# EasyEDA Pro project jackt-tong-yong-xiao-che-kong-zhi-qi-zhuan-li-948f377a.epro, board PCB8_1
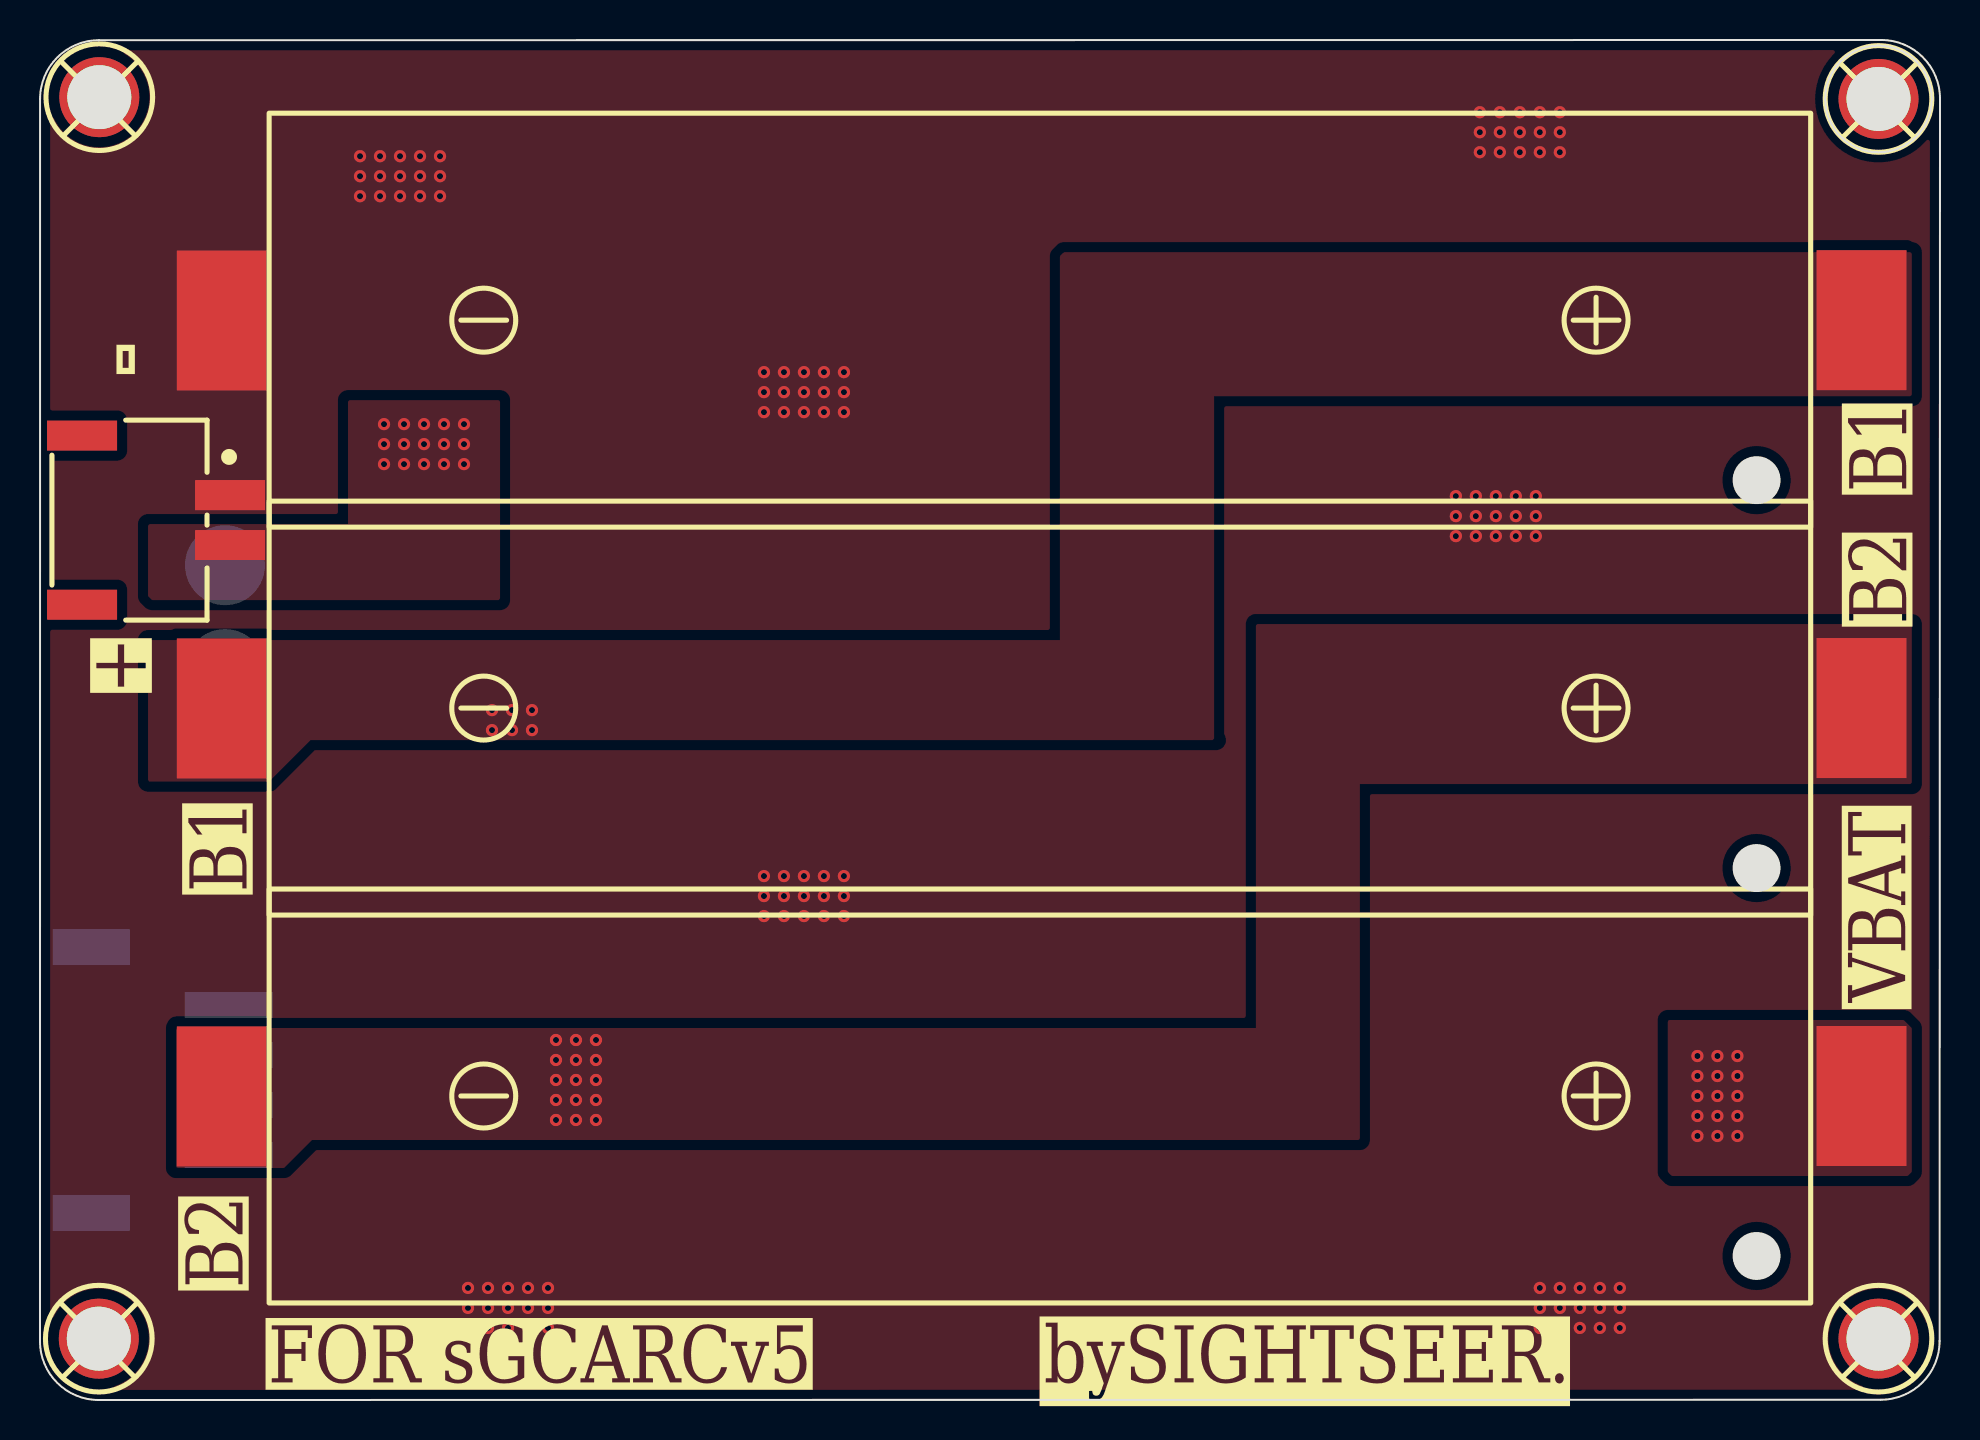
[diagram p12: board, top side]
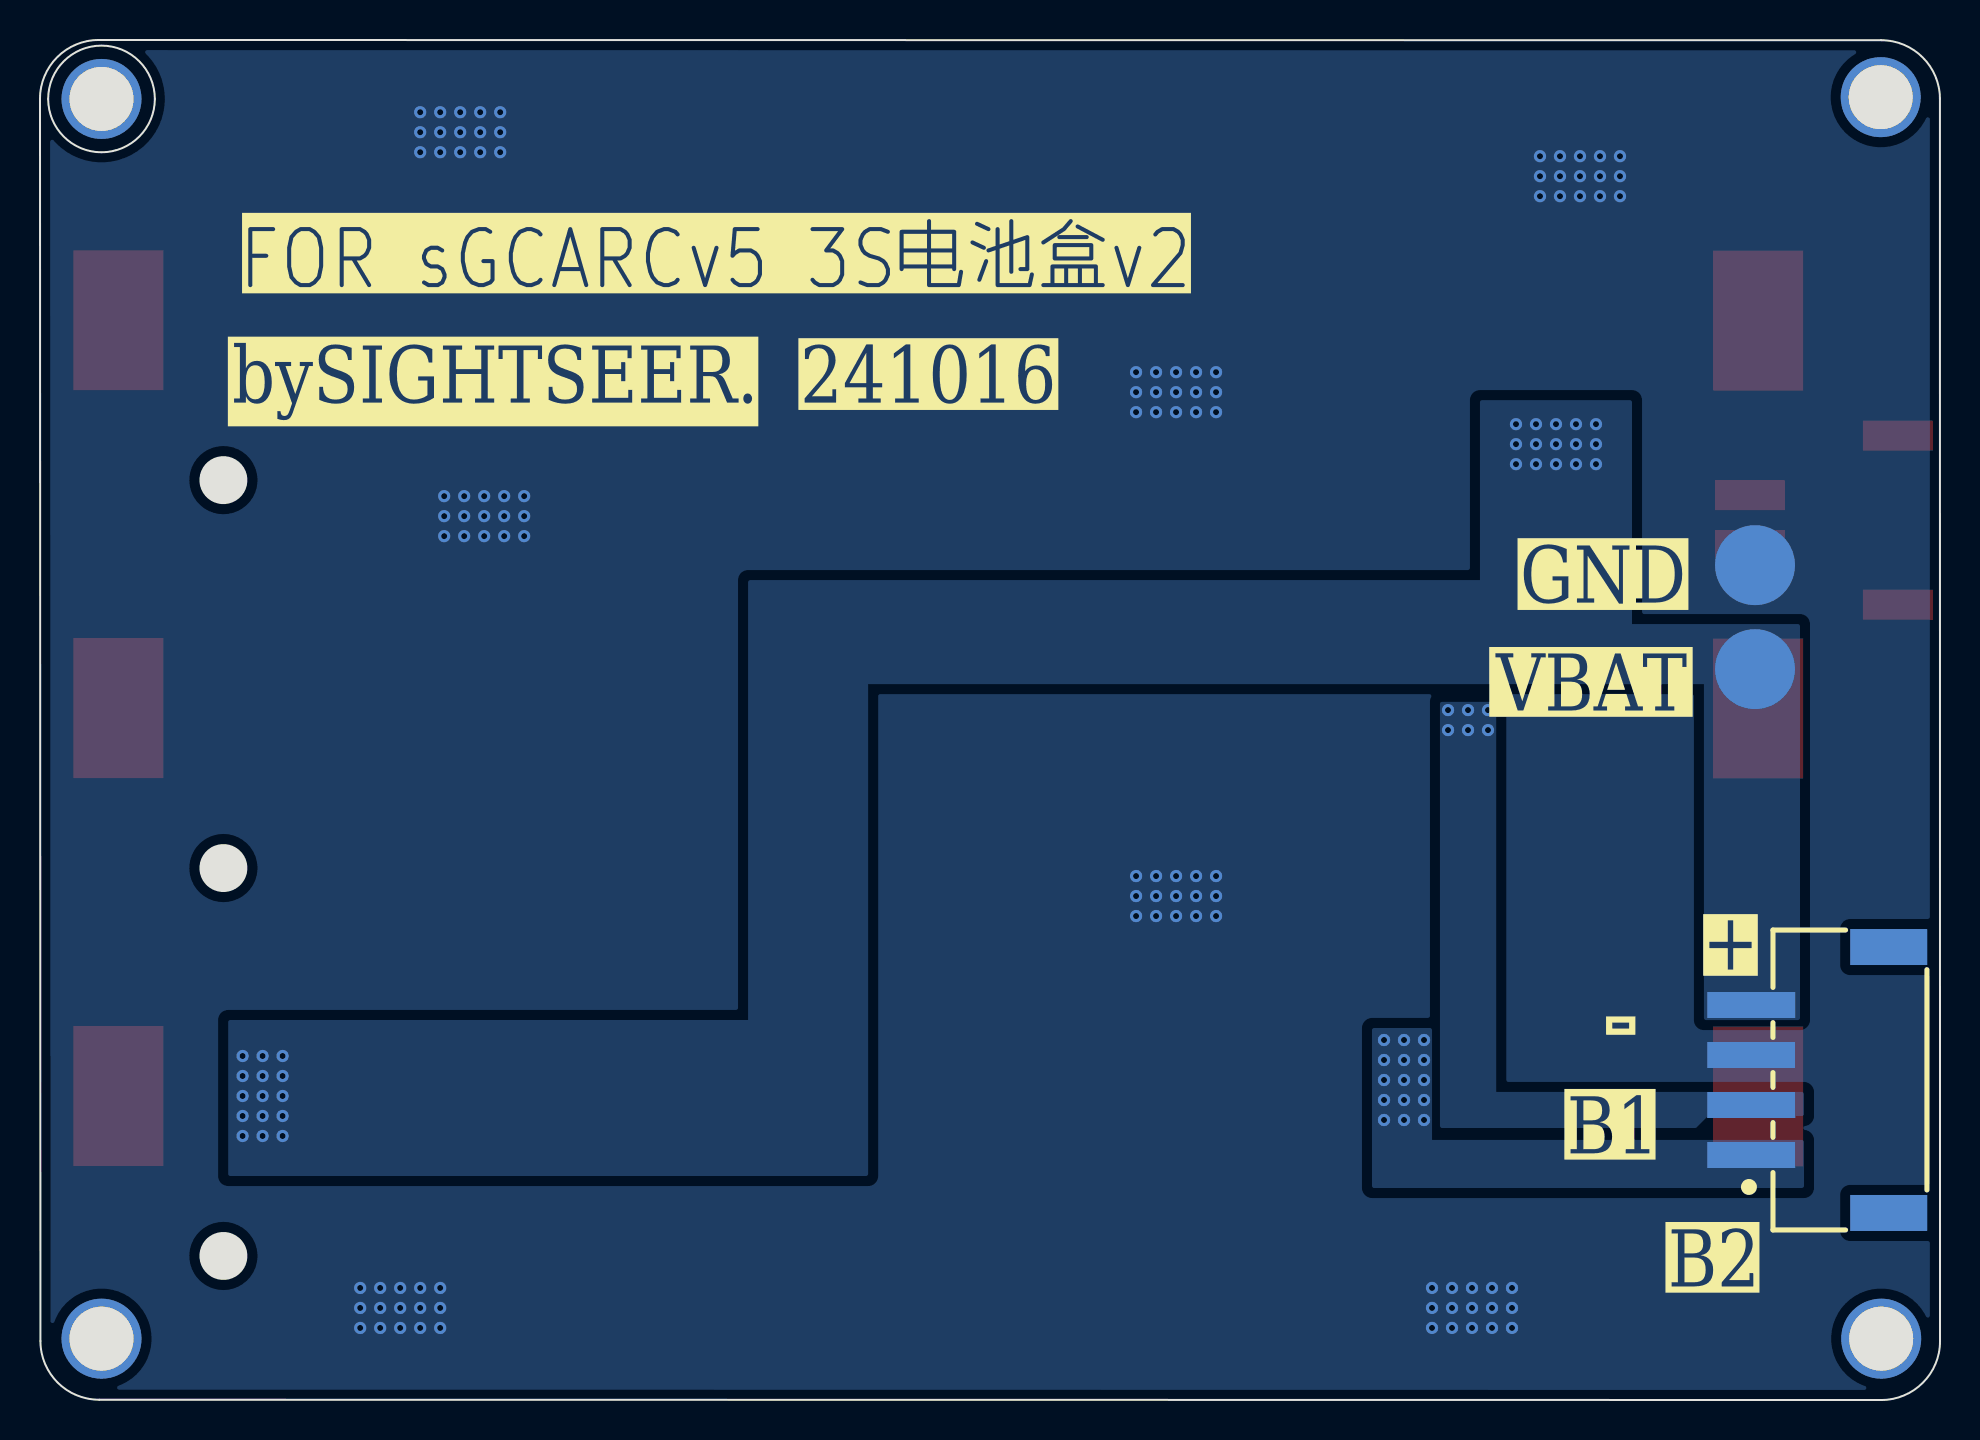
[diagram p13: board, bottom side, seen from below]

Outline 95.02 x 68.02 mm; copper layers: Top Layer, Bottom Layer. Coordinates in mm from the lower left corner of the outline.
Outline path: 0,65.07 0,2.94 arc(0.86,0.86) 2.94,0 92.06,0.01 arc(94.13,0.87) 94.99,2.95 95.02,65.08 arc(94.16,67.16) 92.08,68.02 2.94,68 arc(0.86,67.14) 0,65.07 ; 89.27,65.07 arc(91.94,67.73) 94.61,65.07 arc(91.94,62.4) 89.27,65.07
Stack: Top Layer 0.035mm / Dielectric1 1.51mm FR4 er 4.5 / Bottom Layer 0.035mm

## Design rules (mm)
spacing copperThickness1oz (default): track to track 0.102, other pairs 0.152 to 0.3
spacing copperThickness2oz: track to track 0.203, other pairs 0.152 to 0.3
spacing Plane_innerPlane: track to track 0.102, other pairs 0.152 to 0.3
spacing Copper_copperRegion: track to track 0.102, other pairs 0.152 to 0.3
spacing Copper_copperRegionFULL: track to track 0.102, other pairs 0.152 to 0.3
spacing Copper_copperRegion1: track to track 0.102, other pairs 0.152 to 0.3
track width copperThickness1oz (default): min 0.127, default 0.254, max 2.54
track width copperThickness2oz: min 0.203, default 0.254, max 2.54
differential pair differentialPair (default): width min 0.127, default 0.254, max 2.54; gap min 0.152, default 0.152
net B2 uses copperRegionFULL
net VBAT uses copperRegionFULL
net B1 uses copperRegionFULL
net GND uses copperRegion1
pour e157 uses Copper_copperRegion1, copperRegion_Copper_copperRegion1
pour e159 uses Copper_copperRegionFULL, copperRegion_Copper_copperRegionFULL
pour e161 uses Copper_copperRegionFULL, copperRegion_Copper_copperRegionFULL
pour e163 uses Copper_copperRegionFULL, copperRegion_Copper_copperRegionFULL
pour e165 uses Copper_copperRegionFULL, copperRegion_Copper_copperRegionFULL
pour e167 uses Copper_copperRegionFULL, copperRegion_Copper_copperRegionFULL
pour e169 uses Copper_copperRegionFULL, copperRegion_Copper_copperRegionFULL
pour e171 uses Copper_copperRegionFULL, copperRegion_Copper_copperRegionFULL
pour e173 uses Copper_copperRegionFULL, copperRegion_Copper_copperRegionFULL
pour e175 uses Copper_copperRegion1, copperRegion_Copper_copperRegion1
pour e177 uses Copper_copperRegion1, copperRegion_Copper_copperRegion1

## Placement (name value [footprint] x y rotation side)
BT1  BH-18650-B1BA002  [BATTERY-SMD_18650-1S-L77.1-W20.7-1]  50 15.2 270 top
BT2  BH-18650-B1BA002  [BATTERY-SMD_18650-1S-L77.1-W20.7-1]  50 34.6 270 top
BT3  BH-18650-B1BA002  [BATTERY-SMD_18650-1S-L77.1-W20.7-1]  50 54 270 top
CN1  HCZZ0021-4  [CONN-SMD_HCZZ0021-4]  6 16 90 bottom
CN8  ZX-XH2.54-2PWT  [CONN-SMD_2P-P2.54_MEGASTAR_ZX-XH2.54-2PWT]  5.8 44 270 top
SCREW1  -  [M3螺丝]  3.03 65.09 0 top
SCREW2  -  [M3螺丝]  92 65 0 top
SCREW3  -  [M3螺丝]  3 3 0 top
SCREW4  -  [M3螺丝]  92 3 0 top
TP1  -  [Test-Point-0.5mm]  9.25 36.55 180 bottom
TP2  -  [Test-Point-0.5mm]  9.25 41.75 180 bottom

## Footprints (pads in the part's own frame, mm; a bottom-side part is the same pattern mirrored in y, then rotated)
BATTERY-SMD_18650-1S-L77.1-W20.7-1
  rect 7x4.5 smd: 1(0.02,-40.91) 2(0,41.09)
CONN-SMD_2P-P2.54_MEGASTAR_ZX-XH2.54-2PWT
  rect 1.5x3.5 smd: 1(-1.25,3.7) 2(1.25,3.7) 3(-4.23,-3.7) 4(4.23,-3.7)
CONN-SMD_HCZZ0021-4
  rect 1.3x4.4 smd: 1(-3.75,3.438) 2(-1.25,3.438) 3(1.25,3.438) 4(3.75,3.438)
  rect 1.8x3.85 smd: 5(-6.65,-3.438) 6(6.65,-3.438)
M3螺丝
  round 4 hole 3.2: 1(-0.064,0.064)
Test-Point-0.5mm
  round 4 smd: 1(0,0)

## Nets
As in the schematic.

Pads without a net: CN1 5 6; CN8 3 4; SCREW1 1; SCREW2 1; SCREW3 1; SCREW4 1

## Via types
v1: diameter 0.61, hole 0.305, Top Layer to Bottom Layer, 156 vias

## Routing (per net, layer and track width the routed paths; a pad name or vN(x,y) marks a point on that pad's centre or on a via; arc(x,y) is an arc through that point)
GND:
  vias: v1(16,62.2) v1(16,61.2) v1(16,60.2) v1(17,62.2) v1(17,61.2) v1(17,60.2) v1(18,62.2) v1(18,61.2) v1(18,60.2) v1(19,62.2) v1(19,61.2) v1(19,60.2) v1(20,62.2) v1(20,61.2) v1(20,60.2) v1(21.4,5.6) v1(21.4,4.6) v1(21.4,3.6) v1(22.4,5.6) v1(22.4,4.6) v1(22.4,3.6) v1(23.4,5.6) v1(23.4,4.6) v1(23.4,3.6) v1(24.4,5.6) v1(24.4,4.6) v1(24.4,3.6) v1(25.4,5.6) v1(25.4,4.6) v1(25.4,3.6) v1(36.2,51.4) v1(36.2,50.4) v1(36.2,49.4) v1(36.2,26.2) v1(36.2,25.2) v1(36.2,24.2) v1(37.2,51.4) v1(37.2,50.4) v1(37.2,49.4) v1(37.2,26.2) v1(37.2,25.2) v1(37.2,24.2) v1(38.2,51.4) v1(38.2,50.4) v1(38.2,49.4) v1(38.2,26.2) v1(38.2,25.2) v1(38.2,24.2) v1(39.2,51.4) v1(39.2,50.4) v1(39.2,49.4) v1(39.2,26.2) v1(39.2,25.2) v1(39.2,24.2) v1(40.2,51.4) v1(40.2,50.4) v1(40.2,49.4) v1(40.2,26.2) v1(40.2,25.2) v1(40.2,24.2) v1(70.8,45.2) v1(70.8,44.2) v1(70.8,43.2) v1(71.8,45.2) v1(71.8,44.2) v1(71.8,43.2) v1(72,64.4) v1(72,63.4) v1(72,62.4) v1(72.8,45.2) v1(72.8,44.2) v1(72.8,43.2) v1(73,64.4) v1(73,63.4) v1(73,62.4) v1(73.8,45.2) v1(73.8,44.2) v1(73.8,43.2) v1(74,64.4) v1(74,63.4) v1(74,62.4) v1(74.8,45.2) v1(74.8,44.2) v1(74.8,43.2) v1(75,64.4) v1(75,63.4) v1(75,62.4) v1(75,5.6) v1(75,4.6) v1(75,3.6) v1(76,64.4) v1(76,63.4) v1(76,62.4) v1(76,5.6) v1(76,4.6) v1(76,3.6) v1(77,5.6) v1(77,4.6) v1(77,3.6) v1(78,5.6) v1(78,4.6) v1(78,3.6) v1(79,5.6) v1(79,4.6) v1(79,3.6)
VBAT:
  vias: v1(17.2,48.8) v1(17.2,47.8) v1(17.2,46.8) v1(18.2,48.8) v1(18.2,47.8) v1(18.2,46.8) v1(19.2,48.8) v1(19.2,47.8) v1(19.2,46.8) v1(20.2,48.8) v1(20.2,47.8) v1(20.2,46.8) v1(21.2,48.8) v1(21.2,47.8) v1(21.2,46.8) v1(82.89,17.2) v1(82.89,16.2) v1(82.89,15.2) v1(82.89,14.2) v1(82.89,13.2) v1(83.89,17.2) v1(83.89,16.2) v1(83.89,15.2) v1(83.89,14.2) v1(83.89,13.2) v1(84.89,17.2) v1(84.89,16.2) v1(84.89,15.2) v1(84.89,14.2) v1(84.89,13.2)
B1:
  vias: v1(22.6,34.5) v1(22.6,33.5) v1(23.6,34.5) v1(23.6,33.5) v1(24.6,34.5) v1(24.6,33.5)
B2:
  vias: v1(25.8,18) v1(25.8,17) v1(25.8,16) v1(25.8,15) v1(25.8,14) v1(26.8,18) v1(26.8,17) v1(26.8,16) v1(26.8,15) v1(26.8,14) v1(27.8,18) v1(27.8,17) v1(27.8,16) v1(27.8,15) v1(27.8,14)

## Copper pours and planes (outline as drawn; the poured copper is in the pictures)
GND on Top Layer: 5.4,57.8 13,57.8 13,44.6 5.6,44.6 5.4,44.8
GND on Top Layer: -5.8,73.6 123,73.6 123,-12.8 -5.8,-12.8
GND on Bottom Layer: -18,79.2 110.8,79.2 110.8,-7.2 -18,-7.2
VBAT on Top Layer: 81.4,19 93.2,19 93.6,18.6 93.6,11.4 93.4,11.2 81.6,11.2 81.4,11.4
VBAT on Top Layer: 5.4,43.8 15.4,43.8 15.4,50 23,50 23,40 5.6,40 5.4,40.2
VBAT on Bottom Layer: 15.4,50 23,50 23,41 59.6,41 59.6,19 85.6,19 85.6,11.2 53.6,11.2 53.6,35.8 15.4,35.8
VBAT on Bottom Layer: 7,38.8 17.8,38.8 17.8,35.8 11.8,35.8 11.8,19 7,19
B1 on Top Layer: 5.4,38 51,38 51,57.2 51.2,57.4 93.6,57.4 93.6,50.2 58.72,50.2 58.72,33.09 58.8,33 13.54,33 11.46,30.93 5.4,30.93
B1 on Bottom Layer: 6.8,15.4 22.19,15.4 22.19,34.91 25,34.91 25,13.6 12.2,13.6 11.6,14.2 6.8,14.2
B2 on Top Layer: 6.8,18.6 60.8,18.6 60.8,38.8 93.6,38.8 93.6,30.8 66,30.8 66,13 13.6,13 12.2,11.6 6.8,11.6
B2 on Bottom Layer: 6.8,13 25.4,13 25.4,18.6 28.4,18.6 28.4,10.6 6.8,10.6

## Text on the board
Bottom Silkscreen Layer: + | B2 | - | B1 | GND | VBAT | 241016 | FOR sGCARCv5 3S电池盒v2 | bySIGHTSEER.
Top Silkscreen Layer: FOR sGCARCv5 | bySIGHTSEER. | + | - | B2 | B1 | VBAT
